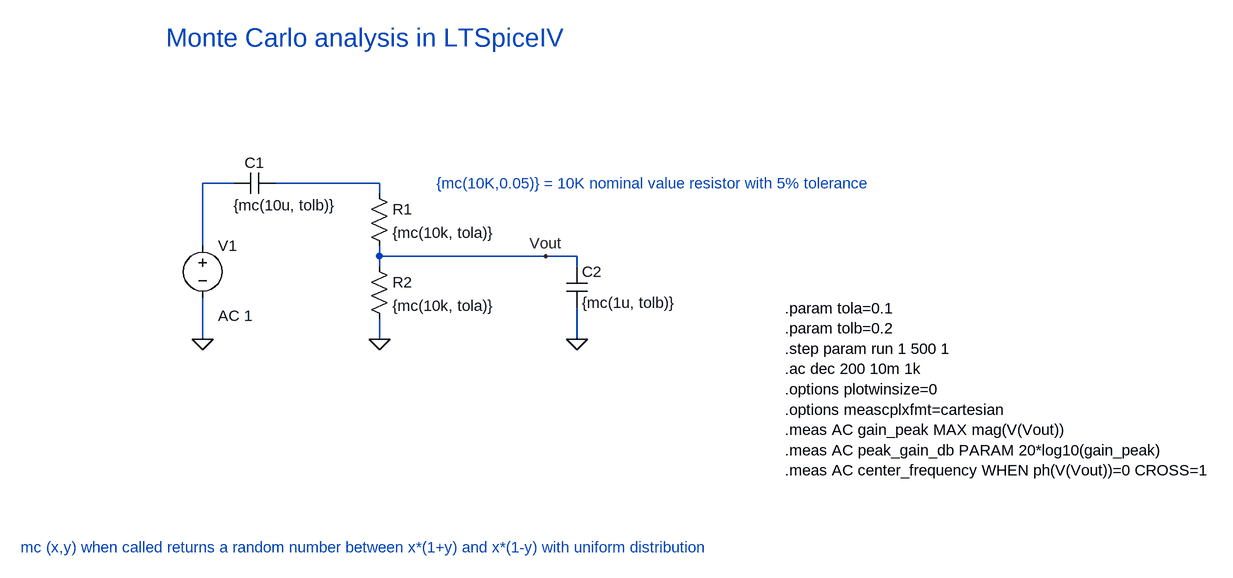
[diagram p0: schematic Monte_Carlo_RC_Band_Pass_Filter_Simulation.asc]
Monte_Carlo_RC_Band_Pass_Filter_Simulation.asc, the LTspice schematic file:
Version 4
SHEET 1 1544 788
WIRE 48 48 0 48
WIRE 272 48 112 48
WIRE 272 64 272 48
WIRE 0 144 0 48
WIRE 272 160 272 144
WIRE 528 160 272 160
WIRE 576 160 528 160
WIRE 272 176 272 160
WIRE 576 176 576 160
WIRE 0 288 0 224
WIRE 272 288 272 256
WIRE 576 288 576 240
FLAG 0 288 0
FLAG 272 288 0
FLAG 576 288 0
FLAG 528 160 Vout
SYMBOL voltage 0 128 R0
WINDOW 123 24 124 Left 2
WINDOW 39 0 0 Left 0
SYMATTR Value2 AC 1
SYMATTR InstName V1
SYMATTR Value ""
SYMBOL cap 112 32 R90
WINDOW 0 0 32 VBottom 2
WINDOW 3 34 -15 VTop 2
SYMATTR InstName C1
SYMATTR Value {mc(10u, tolb)}
SYMBOL res 256 48 R0
SYMATTR InstName R1
SYMATTR Value {mc(10k, tola)}
SYMBOL res 256 160 R0
SYMATTR InstName R2
SYMATTR Value {mc(10k, tola)}
SYMBOL cap 560 176 R0
SYMATTR InstName C2
SYMATTR Value {mc(1u, tolb)}
TEXT -280 608 Left 2 ;mc (x,y) when called returns a random number between x*(1+y) and x*(1-y) with uniform distribution
TEXT 360 48 Left 2 ;{mc(10K,0.05)} = 10K nominal value resistor with 5% tolerance
TEXT -56 -176 Left 4 ;Monte Carlo analysis in LTSpiceIV
TEXT 896 240 Left 2 !.param tola=0.1\n.param tolb=0.2\n.step param run 1 500 1\n.ac dec 200 10m 1k\n.options plotwinsize=0\n.options meascplxfmt=cartesian\n.meas AC gain_peak MAX mag(V(Vout))\n.meas AC peak_gain_db PARAM 20*log10(gain_peak)\n.meas AC center_frequency WHEN ph(V(Vout))=0 CROSS=1

The netlist it stands for:
* Monte_Carlo_RC_Band_Pass_Filter_Simulation.asc
V1 N001 0 AC 1
C1 N002 N001 {mc(10u, tolb)}
R1 N002 Vout {mc(10k, tola)}
R2 Vout 0 {mc(10k, tola)}
C2 Vout 0 {mc(1u, tolb)}
* mc (x,y) when called returns a random number between x*(1+y) and x*(1-y) with uniform distribution
* {mc(10K,0.05)} = 10K nominal value resistor with 5% tolerance
* Monte Carlo analysis in LTSpiceIV
.param tola=0.1
.param tolb=0.2
.step param run 1 500 1
.ac dec 200 10m 1k
.options plotwinsize=0
.options meascplxfmt=cartesian
.meas AC gain_peak MAX mag(V(Vout))
.meas AC peak_gain_db PARAM 20*log10(gain_peak)
.meas AC center_frequency WHEN ph(V(Vout))=0 CROSS=1
.backanno
.end